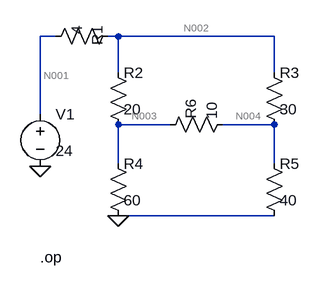
[diagram p0: schematic Ex01.asc]
Ex01.asc, the LTspice schematic file:
Version 4
SHEET 1 880 680
WIRE 60 200 60 80
WIRE 60 80 84 80
WIRE 164 80 180 80
WIRE 180 80 180 136
WIRE 180 80 420 80
WIRE 420 80 420 136
WIRE 180 216 180 276
WIRE 420 216 420 276
WIRE 180 216 260 216
WIRE 340 216 420 216
WIRE 180 356 420 356
FLAG 60 280 0
FLAG 180 356 0
SYMBOL voltage 60 184 R0
WINDOW 0 24 16 Left 2
WINDOW 3 24 72 Left 2
SYMATTR InstName V1
SYMATTR Value 24
SYMBOL res 180 64 R90
WINDOW 0 0 32 Left 2
WINDOW 3 0 64 Left 2
SYMATTR InstName R1
SYMATTR Value 4
SYMBOL res 164 120 R0
WINDOW 0 24 16 Left 2
WINDOW 3 24 72 Left 2
SYMATTR InstName R2
SYMATTR Value 20
SYMBOL res 404 120 R0
WINDOW 0 24 16 Left 2
WINDOW 3 24 72 Left 2
SYMATTR InstName R3
SYMATTR Value 30
SYMBOL res 244 232 R270
WINDOW 0 24 48 Left 2
WINDOW 3 24 80 Left 2
SYMATTR InstName R6
SYMATTR Value 10
SYMBOL res 164 260 R0
WINDOW 0 24 16 Left 2
WINDOW 3 24 72 Left 2
SYMATTR InstName R4
SYMATTR Value 60
SYMBOL res 404 260 R0
WINDOW 0 24 16 Left 2
WINDOW 3 24 72 Left 2
SYMATTR InstName R5
SYMATTR Value 40
TEXT 60 420 Left 2 !.op

The netlist it stands for:
* Ex01.asc
V1 N001 0 24
R1 N002 N001 4
R2 N002 N003 20
R3 N002 N004 30
R6 N003 N004 10
R4 N003 0 60
R5 N004 0 40
.op
.backanno
.end

* Results of the author's LTspice run, read from the files saved beside the schematic
* Operating Point:
*   V(n001) = 24 V
*   V(n002) = 21.62 V
*   V(n003) = 14.84 V
*   V(n004) = 13.92 V
*   I(R1) = -595.4 mA
*   I(R2) = 338.9 mA
*   I(R3) = 256.5 mA
*   I(R4) = 247.3 mA
*   I(R5) = 348.1 mA
*   I(R6) = 91.6 mA
*   I(V1) = -595.4 mA